# Altium schematic sheet Sensors_Board.SchDoc (part 1 of 2)
size A2; SheetNumber: 1; SheetTotal: 1
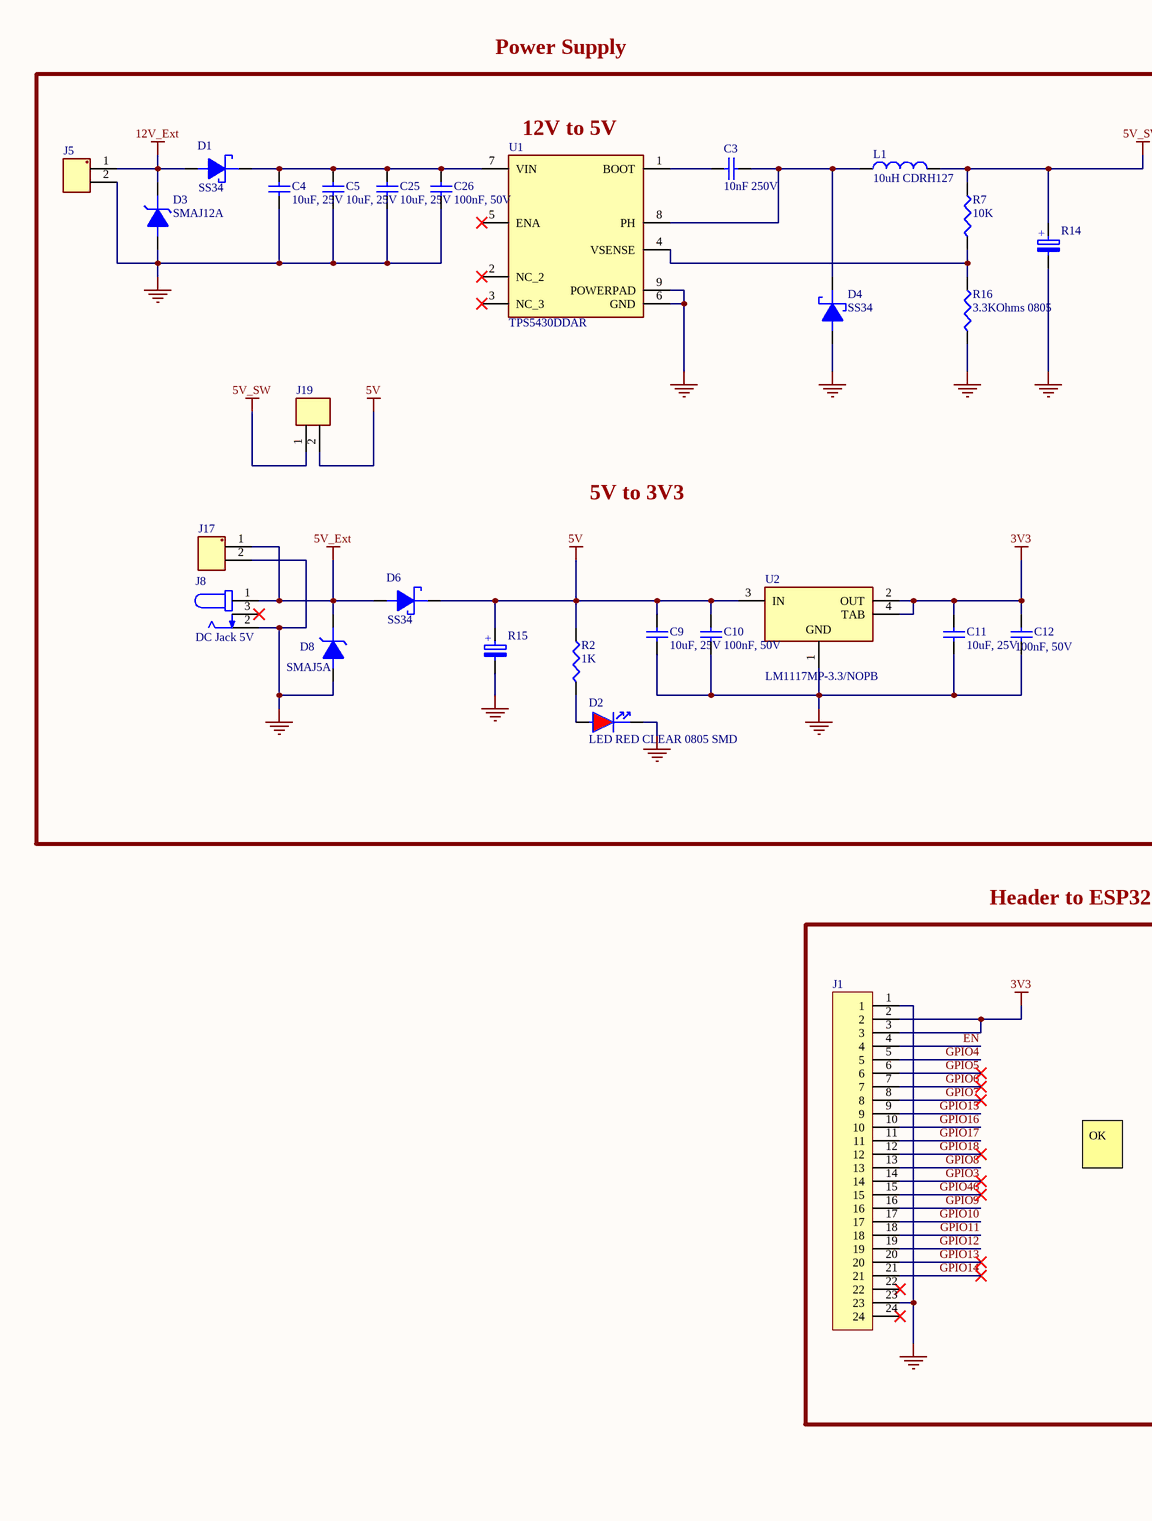
[diagram p0: Sensors_Board.SchDoc, left]
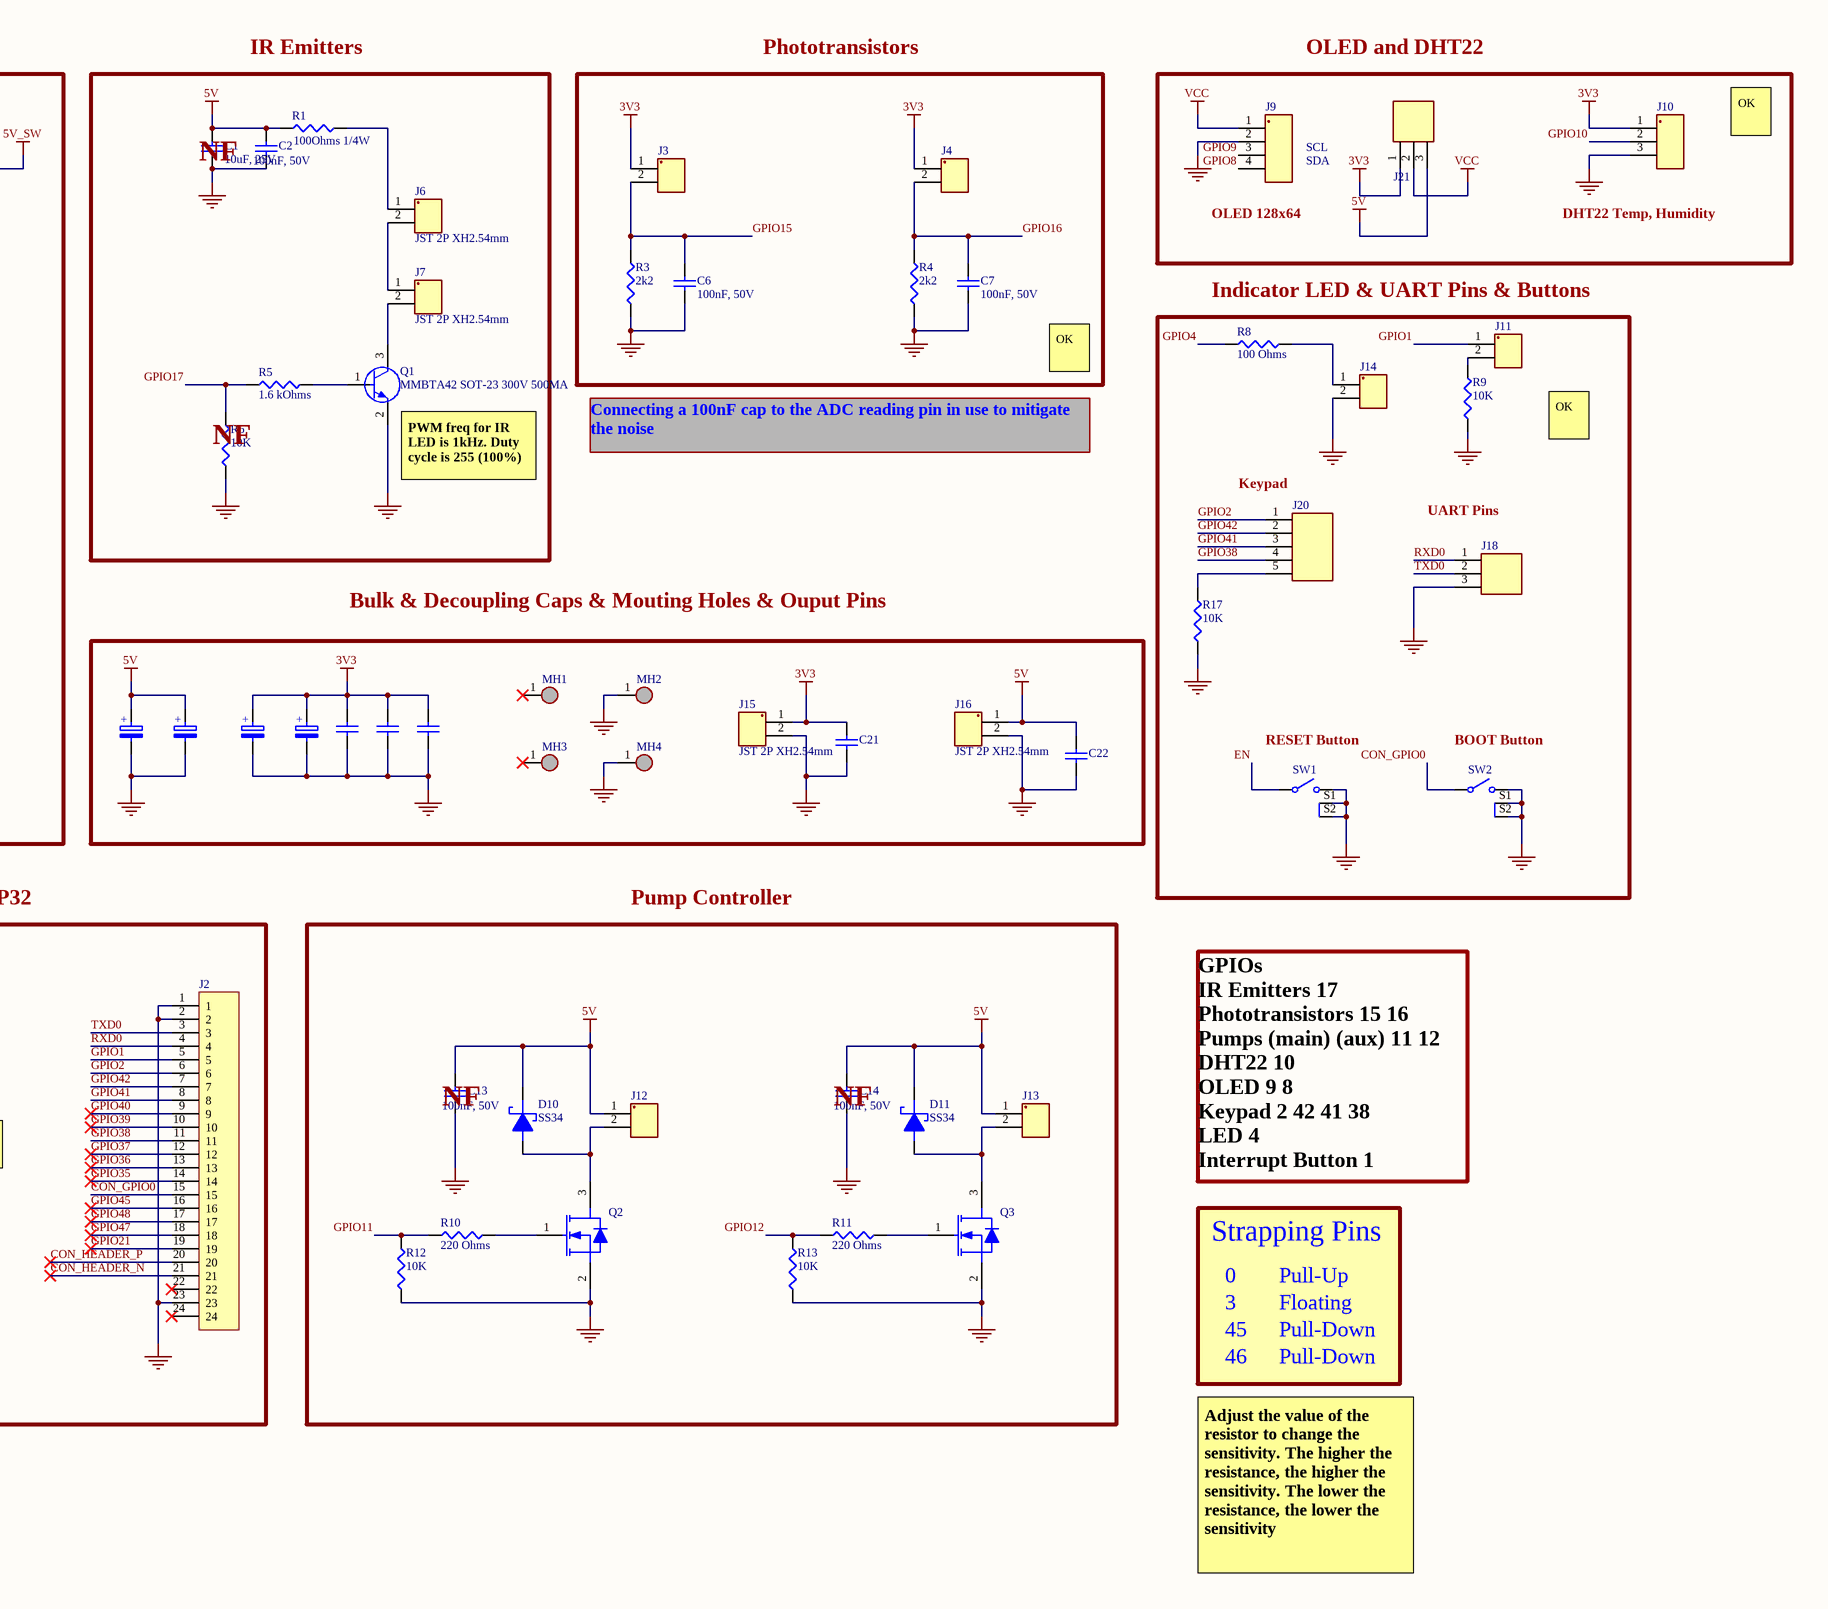
[diagram p1: Sensors_Board.SchDoc, right]

## Parts
C1  10uF, 25V  [CAPC2012X140N]
C2  100nF, 50V  [CAPC2012X140N]
C3  10nF 250V  [CAPC2012X140N]
C4  10uF, 25V  [CAPC2012X140N]
C5  10uF, 25V  [CAPC2012X140N]
C6  100nF, 50V  [CAPC2012X140N]
C7  100nF, 50V  [CAPC2012X140N]
C9  10uF, 25V  [CAPC2012X140N]
C10  100nF, 50V  [CAPC2012X140N]
C11  10uF, 25V  [CAPC2012X140N]
C12  100nF, 50V  [CAPC2012X140N]
C13  100nF, 50V  [CAPC2012X140N]
C14  100nF, 50V  [CAPC2012X140N]
C15  100uF 25V  [CAP_EEEHD1A221AP]  (value not drawn)
C16  100nF, 50V  [CAPC2012X140N]  (value not drawn)
C18  100nF, 50V  [CAPC2012X140N]  (value not drawn)
C19  100nF, 50V  [CAPC2012X140N]  (value not drawn)
C20  10uF 35V  [CAP_EEHZA1H100R]  (value not drawn)
C21  100nF, 50V  [CAPC2012X140N]  (value not drawn)
C22  100nF, 50V  [CAPC2012X140N]  (value not drawn)
C23  4.7uF  [CAP_EEEHD1E4R7AR]  (value not drawn)
C24  4.7uF  [CAP_EEEHD1E4R7AR]  (value not drawn)
C25  10uF, 25V  [CAPC2012X140N]
C26  100nF, 50V  [CAPC2012X140N]
D1  SS34  [DO-214AC, SMA]
D2  LED RED CLEAR 0805 SMD  [LED 0805]
D3  SMAJ12A  [DO-214AC, SMA]
D4  SS34  [DO-214AC, SMA]
D6  SS34  [DO-214AC, SMA]
D8  SMAJ5A  [DO-214AC, SMA]
D10  SS34  [DO-214AC, SMA]
D11  SS34  [DO-214AC, SMA]
J1  1x24P Female Header  [FEMALE_HEADER_1x24]  (value not drawn)
J2  1x24P Female Header  [FEMALE_HEADER_1x24]  (value not drawn)
J3  JST 2P XH2.54mm  [JST 2P XH2.54mm]  (value not drawn)
J4  JST 2P XH2.54mm  [JST 2P XH2.54mm]  (value not drawn)
J5  Terminal Block 2P_3.5MM  [TERMINAL BLOCK 2P3.5MM]  (value not drawn)
J6  JST 2P XH2.54mm  [JST 2P XH2.54mm]
J7  JST 2P XH2.54mm  [JST 2P XH2.54mm]
J8  DC Jack 5V  [DC Barrel Jack 5V]
J9  JST 4P XH2.54mm  [JST 4P XH2.54mm]  (value not drawn)
J10  JST 3P XH2.54mm  [JST 3P XH2.54mm]  (value not drawn)
J11  JST 2P XH2.54mm  [JST 2P XH2.54mm]  (value not drawn)
J12  JST 2P XH2.54mm  [JST 2P XH2.54mm]  (value not drawn)
J13  JST 2P XH2.54mm  [JST 2P XH2.54mm]  (value not drawn)
J14  JST 2P XH2.54mm  [JST 2P XH2.54mm]  (value not drawn)
J15  JST 2P XH2.54mm  [JST 2P XH2.54mm]
J16  JST 2P XH2.54mm  [JST 2P XH2.54mm]
J17  Terminal Block 2P_3.5MM  [TERMINAL BLOCK 2P3.5MM]  (value not drawn)
J18  1x3P Header  [HEADER 1X3]  (value not drawn)
J19  1X2P 2.54mm Header  [HEADER_1X2]  (value not drawn)
J20  1x5P Header  [HEADER_1x5]  (value not drawn)
J21  1X3P 1.27mm Header  [HEADER 1x3_1.27MM]  (value not drawn)
L1  10uH CDRH127  [DR127_Inductor]
MH1  MH_7.5mm x 3.2mm  [MH_7P5MMX3P2MM]  (value not drawn)  (no BOM)
MH2  MH_7.5mm x 3.2mm  [MH_7P5MMX3P2MM]  (value not drawn)  (no BOM)
MH3  MH_7.5mm x 3.2mm  [MH_7P5MMX3P2MM]  (value not drawn)  (no BOM)
MH4  MH_7.5mm x 3.2mm  [MH_7P5MMX3P2MM]  (value not drawn)  (no BOM)
Q1  MMBTA42 SOT-23 300V 500MA  [FP-SS8050-G-IPC_A]
Q2  N-MOS LN2302LT1G  [FP-SS8050-G-IPC_A]  (value not drawn)
Q3  N-MOS LN2302LT1G  [FP-SS8050-G-IPC_A]  (value not drawn)
R1  100Ohms 1/4W  [1206_RES_1/4W]
R2  1K  [0805_RES_1/8W]
R3  2k2  [0805_RES_1/8W]
R4  2k2  [0805_RES_1/8W]
R5  1.6 kOhms  [0805_RES_1/8W]
R6  10K  [0805_RES_1/8W]
R7  10K  [0805_RES_1/8W]
R8  100 Ohms  [0805_RES_1/8W]
R9  10K  [0805_RES_1/8W]
R10  220 Ohms  [0805_RES_1/8W]
R11  220 Ohms  [0805_RES_1/8W]
R12  10K  [0805_RES_1/8W]
R13  10K  [0805_RES_1/8W]
R14  220uF 2312 Tanta  [Tantalum 2312 (6032 Metric)]  (value not drawn)
R15  220uF 2312 Tanta  [Tantalum 2312 (6032 Metric)]  (value not drawn)
R16  3.3KOhms 0805  [0805_RES_1/8W]
R17  10K  [0805_RES_1/8W]
SW1  Tactile Button Right Angle  [Right Angle Tactile Button]  (value not drawn)
SW2  Tactile Button Right Angle  [Right Angle Tactile Button]  (value not drawn)
U1  TPS5430DDAR  [TPS5430DDAR]
U2  LM1117MP-3.3/NOPB  [SOT223-4]

## Blocks framed on the sheet
Phototransistors: C6 C7 J3 J4 R3 R4
OLED and DHT22: J9 J10 J21
Indicator LED & UART Pins & Buttons: J11 J14 J18 J20 R8 R9 R17 SW1 SW2
Header to ESP32: J1 J2

## Nets
3V3: C11.2 C12.2 C16.2 C18.2 C19.2 C20.1(A) C21.2 C23.1(A) J1.2 J1.3 J3.1 J4.1 J10.1 J15.1 J21.1 U2.2(OUT) U2.4(TAB)
5V: C1.2 C2.2 C9.2 C10.2 C13.2 C14.2 C15.1(A) C22.2 C24.1(A) D6.2 D10.2 D11.2 J12.1 J13.1 J16.1 J19.2 J21.3 R1.1 R2.2 R15.1(A) U2.3(IN)
5V_Ext: D6.1 D8.2 J8.1 J17.1
5V_SW: J19.1 L1.2 R7.2 R14.1(A)
12V_Ext: D1.1 D3.2 J5.1
GND: C1.1 C2.1 C4.1 C5.1 C6.1 C7.1 C9.1 C10.1 C11.1 C12.1 C13.1 C14.1 C15.2(C) C16.1 C18.1 C19.1 C20.2(C) C21.1 C22.1 C23.2(C) C24.2(C) C25.1 C26.2 D2.2 D3.1 D4.1 D8.1 J1.1 J1.23 J2.1 J2.2 J2.23 J5.2 J8.2 J9.2 J10.3 J14.2 J15.2 J16.2 J17.2 J18.3 MH2.1 MH4.1 Q1.2(E) Q2.2(S) Q3.2(S) R3.1 R4.1 R6.1 R9.1 R12.1 R13.1 R14.2(C) R15.2(C) R16.1 R17.1 SW1.2 SW1.S1 SW1.S2 SW2.2 SW2.S1 SW2.S2 U1.6(GND) U1.9(POWERPAD) U2.1(GND)
VCC: J9.1 J21.2
CON_GPIO0: J2.15 SW2.1
CON_HEADER_N: J2.21
CON_HEADER_P: J2.20
EN: J1.4 SW1.1
GPIO1: J2.5 J11.1
GPIO2: J2.6 J20.1
GPIO3: J1.14
GPIO4: J1.5 R8.1
GPIO5: J1.6
GPIO6: J1.7
GPIO7: J1.8
GPIO8: J1.13 J9.4
GPIO9: J1.16 J9.3
GPIO10: J1.17 J10.2
GPIO11: J1.18 R10.1 R12.2
GPIO12: J1.19 R11.1 R13.2
GPIO13: J1.20
GPIO14: J1.21
GPIO15: C6.2 J1.9 J3.2 R3.2
GPIO16: C7.2 J1.10 J4.2 R4.2
GPIO17: J1.11 R5.1 R6.2
GPIO18: J1.12
GPIO21: J2.19
GPIO35: J2.14
GPIO36: J2.13
GPIO37: J2.12
GPIO38: J2.11 J20.4
GPIO39: J2.10
GPIO40: J2.9
GPIO41: J2.8 J20.3
GPIO42: J2.7 J20.2
GPIO45: J2.16
GPIO46: J1.15
GPIO47: J2.18
GPIO48: J2.17
RXD0: J2.4 J18.1
TXD0: J2.3 J18.2
NetC3_1: C3.1 U1.1(BOOT)
NetC3_2: C3.2 D4.2 L1.1 U1.8(PH)
NetC4_2: C4.2 C5.2 C25.2 C26.1 D1.2 U1.7(VIN)
NetD2_1: D2.1 R2.1
NetD10_1: D10.1 J12.2 Q2.3(D)
NetD11_1: D11.1 J13.2 Q3.3(D)
NetJ6_1: J6.1 R1.2
NetJ6_2: J6.2 J7.1
NetJ7_2: J7.2 Q1.3(C)
NetJ11_2: J11.2 R9.2
NetJ14_1: J14.1 R8.2
NetJ20_5: J20.5 R17.2
NetQ1_1: Q1.1(B) R5.2
NetQ2_1: Q2.1(G) R10.2
NetQ3_1: Q3.1(G) R11.2
NetR7_1: R7.1 R16.2 U1.4(VSENSE)

Not connected (* = marked no-connect by the designer): J1 22* 24*; J2 22* 24*; J8 3*; MH1 1*; MH3 1*; U1 2(NC_2)* 3(NC_3)* 5(ENA)*

## Notes on the sheet
- Power Supply
- IR Emitters
- (near U1) 12V to 5V
- (near J9) SCL
- OK
- (near C1) NF
- (near J9) OLED 128x64
- (near J9) SDA
- (near J10) DHT22 Temp, Humidity
- (near R6) NF
- (near Q1) PWM freq for IR LED is 1kHz. Duty cycle is 255 (100%)
- Connecting a 100nF cap to the ADC reading pin in use to mitigate the noise
- (near J20) Keypad
- 5V to 3V3
- (near J18) UART Pins
- Bulk & Decoupling Caps & Mouting Holes & Ouput Pins
- (near SW1) RESET Button
- (near SW2) BOOT Button
- Pump Controller
- (near C13) NF
- (near C14) NF
- GPIOs
  IR Emitters 17
  Phototransistors 15 16
  Pumps (main) (aux) 11 12
  DHT22 10
  OLED 9 8
  Keypad 2 42 41 38
  LED 4
  Interrupt Button 1
- Strapping Pins
- 0
- Pull-Up
- 45
- 46
- 3
- Pull-Down
- Floating
- Adjust the value of the resistor to change the sensitivity. The higher the resistance, the higher the sensitivity. The lower the resistance, the lower the sensitivity
- (in symbol 10SVP4R7M) +
- (in symbol 25SVPF100M) +
- (in symbol EEH-ZA1H100R) +
- (in symbol TAJC227K006RNJ) +